# Altium schematic sheet Controller-Sheet.SchDoc
size 420 x 297 mm; SheetNumber: 4; SheetTotal: 5
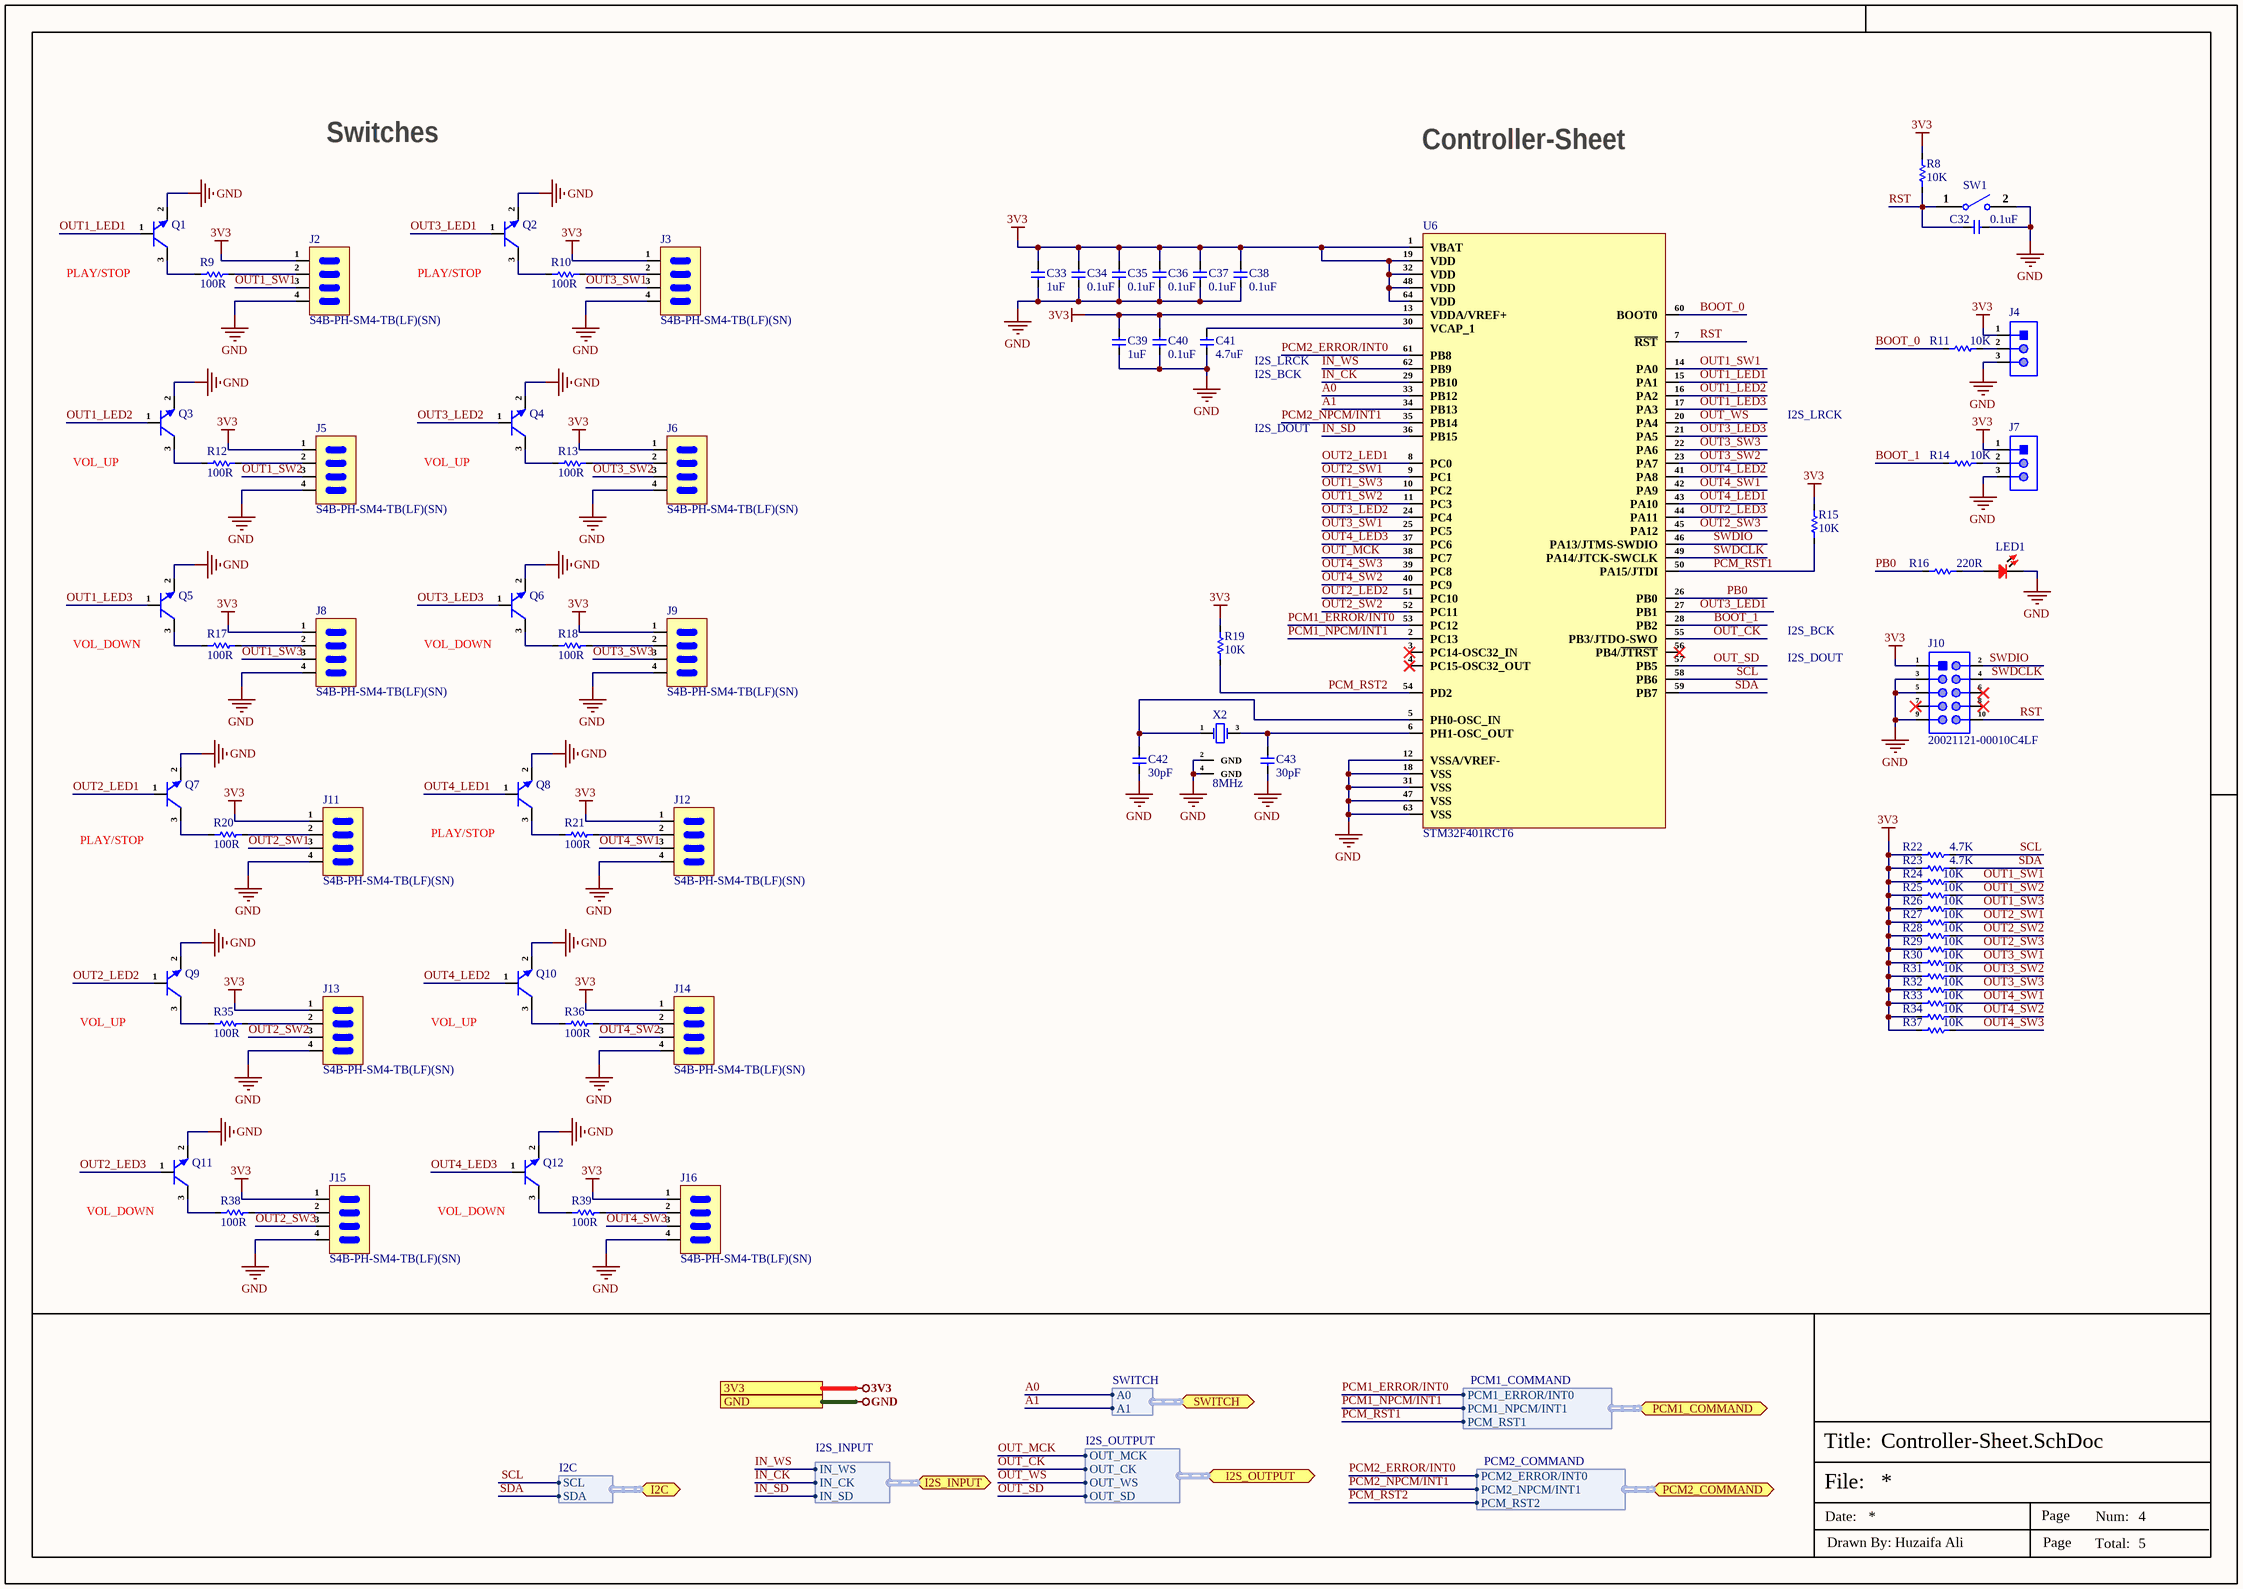
[diagram p0: Controller-Sheet.SchDoc]

## Parts
C32  0.1uF  [Cap-0402]
C33  1uF  [Cap-0402]
C34  0.1uF  [Cap-0402]
C35  0.1uF  [Cap-0402]
C36  0.1uF  [Cap-0402]
C37  0.1uF  [Cap-0402]
C38  0.1uF  [Cap-0402]
C39  1uF  [Cap-0402]
C40  0.1uF  [Cap-0402]
C41  4.7uF  [Cap-0402]
C42  30pF  [Cap-0402]
C43  30pF  [Cap-0402]
J2  S4B-PH-SM4-TB(LF)(SN)  [S4B-PH-SM4-TB(LF)(SN)]
J3  S4B-PH-SM4-TB(LF)(SN)  [S4B-PH-SM4-TB(LF)(SN)]
J4  X6511WV-03H-C60D30  [HDR1X3_]  (value not drawn)
J5  S4B-PH-SM4-TB(LF)(SN)  [S4B-PH-SM4-TB(LF)(SN)]
J6  S4B-PH-SM4-TB(LF)(SN)  [S4B-PH-SM4-TB(LF)(SN)]
J7  X6511WV-03H-C60D30  [HDR1X3_]  (value not drawn)
J8  S4B-PH-SM4-TB(LF)(SN)  [S4B-PH-SM4-TB(LF)(SN)]
J9  S4B-PH-SM4-TB(LF)(SN)  [S4B-PH-SM4-TB(LF)(SN)]
J10  20021121-00010C4LF  [20021121-00010C4LF_]
J11  S4B-PH-SM4-TB(LF)(SN)  [S4B-PH-SM4-TB(LF)(SN)]
J12  S4B-PH-SM4-TB(LF)(SN)  [S4B-PH-SM4-TB(LF)(SN)]
J13  S4B-PH-SM4-TB(LF)(SN)  [S4B-PH-SM4-TB(LF)(SN)]
J14  S4B-PH-SM4-TB(LF)(SN)  [S4B-PH-SM4-TB(LF)(SN)]
J15  S4B-PH-SM4-TB(LF)(SN)  [S4B-PH-SM4-TB(LF)(SN)]
J16  S4B-PH-SM4-TB(LF)(SN)  [S4B-PH-SM4-TB(LF)(SN)]
LED1  RED  [LED-0603]  (value not drawn)
Q1  DDTD113ZC-7-F  [SOT-23]  (value not drawn)
Q2  DDTD113ZC-7-F  [SOT-23]  (value not drawn)
Q3  DDTD113ZC-7-F  [SOT-23]  (value not drawn)
Q4  DDTD113ZC-7-F  [SOT-23]  (value not drawn)
Q5  DDTD113ZC-7-F  [SOT-23]  (value not drawn)
Q6  DDTD113ZC-7-F  [SOT-23]  (value not drawn)
Q7  DDTD113ZC-7-F  [SOT-23]  (value not drawn)
Q8  DDTD113ZC-7-F  [SOT-23]  (value not drawn)
Q9  DDTD113ZC-7-F  [SOT-23]  (value not drawn)
Q10  DDTD113ZC-7-F  [SOT-23]  (value not drawn)
Q11  DDTD113ZC-7-F  [SOT-23]  (value not drawn)
Q12  DDTD113ZC-7-F  [SOT-23]  (value not drawn)
R8  10K  [Res-0402]
R9  100R  [Res-0603]
R10  100R  [Res-0603]
R11  10K  [Res-0402]
R12  100R  [Res-0603]
R13  100R  [Res-0603]
R14  10K  [Res-0402]
R15  10K  [Res-0402]
R16  220R  [Res-0603]
R17  100R  [Res-0603]
R18  100R  [Res-0603]
R19  10K  [Res-0402]
R20  100R  [Res-0603]
R21  100R  [Res-0603]
R22  4.7K  [Res-0402]
R23  4.7K  [Res-0402]
R24  10K  [Res-0402]
R25  10K  [Res-0402]
R26  10K  [Res-0402]
R27  10K  [Res-0402]
R28  10K  [Res-0402]
R29  10K  [Res-0402]
R30  10K  [Res-0402]
R31  10K  [Res-0402]
R32  10K  [Res-0402]
R33  10K  [Res-0402]
R34  10K  [Res-0402]
R35  100R  [Res-0603]
R36  100R  [Res-0603]
R37  10K  [Res-0402]
R38  100R  [Res-0603]
R39  100R  [Res-0603]
SW1  B3U-1000P  [B3U-1000P]  (value not drawn)
U6  STM32F401RCT6  [64-LQFP (10x10)]
X2  8MHz  [5TJ480000XYLBC_]

## Ports
3V3 (see Top_Sheet[3A], I2S-to-SPDIF-Sheet[3D], Power-Sheet[4D], SPDIF-to-I2S-Sheet[3D]), GND (see Top_Sheet[3B], I2S-to-SPDIF-Sheet[3D], Power-Sheet[4D], SPDIF-to-I2S-Sheet[3D]), I2C (bidir, harness I2C, see Top_Sheet[3B], I2S-to-SPDIF-Sheet[2D], SPDIF-to-I2S-Sheet[2D]), I2S_INPUT (bidir, harness I2S_INPUT, see Top_Sheet[3B], SPDIF-to-I2S-Sheet[2D]), I2S_OUTPUT (bidir, harness I2S_OUTPUT, see Top_Sheet[4B], I2S-to-SPDIF-Sheet[2D]), PCM1_COMMAND (bidir, harness PCM1_COMMAND, see Top_Sheet[3B], SPDIF-to-I2S-Sheet[2D]), PCM2_COMMAND (bidir, harness PCM2_COMMAND, see Top_Sheet[4B], I2S-to-SPDIF-Sheet[2D]), SWITCH (bidir, harness SWITCH, see Top_Sheet[4B], I2S-to-SPDIF-Sheet[5D])

## Harnesses
I2S_INPUT: IN_WS, IN_CK, IN_SD
I2C: SCL, SDA
PCM2_COMMAND: PCM2_ERROR/INT0, PCM2_NPCM/INT1, PCM_RST2
PCM1_COMMAND: PCM1_ERROR/INT0, PCM1_NPCM/INT1, PCM_RST1
SWITCH: A0, A1
I2S_OUTPUT: OUT_MCK, OUT_CK, OUT_WS, OUT_SD

## Nets
3V3: C33.2 C34.2 C35.2 C36.2 C37.2 C38.2 C39.2 C40.2 J2.1 J3.1 J4.1 J5.1 J6.1 J7.1 J8.1 J9.1 J10.1 J11.1 J12.1 J13.1 J14.1 J15.1 J16.1 R8.2 R15.1 R19.1 R22.1 R23.1 R24.2 R25.2 R26.2 R27.2 R28.2 R29.2 R30.2 R31.2 R32.2 R33.2 R34.2 R37.2 U6.1(VBAT) U6.13(VDDA/VREF+) U6.19(VDD) U6.32(VDD) U6.48(VDD) U6.64(VDD) ; port 3V3
GND: C32.1 C33.1 C34.1 C35.1 C36.1 C37.1 C38.1 C39.1 C40.1 C41.1 C42.1 C43.1 J2.4 J3.4 J4.3 J5.4 J6.4 J7.3 J8.4 J9.4 J10.3 J10.5 J10.9 J11.4 J12.4 J13.4 J14.4 J15.4 J16.4 LED1.2 Q1.2(E) Q2.2(E) Q3.2(E) Q4.2(E) Q5.2(E) Q6.2(E) Q7.2(E) Q8.2(E) Q9.2(E) Q10.2(E) Q11.2(E) Q12.2(E) SW1.2 U6.12(VSSA/VREF-) U6.18(VSS) U6.31(VSS) U6.47(VSS) U6.63(VSS) X2.2(GND) X2.4(GND) ; port GND
A0: U6.33(PB12) ; port SWITCH.A0
A1: U6.34(PB13) ; port SWITCH.A1
BOOT_0: R11.2 U6.60(BOOT0)
BOOT_1: R14.2 U6.28(PB2)
IN_CK: U6.29(PB10) ; port I2S_INPUT.IN_CK
IN_SD: U6.36(PB15) ; port I2S_INPUT.IN_SD
IN_WS: U6.62(PB9) ; port I2S_INPUT.IN_WS
OUT1_LED1: Q1.1(B) U6.15(PA1)
OUT1_LED2: Q3.1(B) U6.16(PA2)
OUT1_LED3: Q5.1(B) U6.17(PA3)
OUT1_SW1: J2.3 R24.1 U6.14(PA0)
OUT1_SW2: J5.3 R25.1 U6.11(PC3)
OUT1_SW3: J8.3 R26.1 U6.10(PC2)
OUT2_LED1: Q7.1(B) U6.8(PC0)
OUT2_LED2: Q9.1(B) U6.51(PC10)
OUT2_LED3: Q11.1(B) U6.44(PA11)
OUT2_SW1: J11.3 R27.1 U6.9(PC1)
OUT2_SW2: J13.3 R28.1 U6.52(PC11)
OUT2_SW3: J15.3 R29.1 U6.45(PA12)
OUT3_LED1: Q2.1(B) U6.27(PB1)
OUT3_LED2: Q4.1(B) U6.24(PC4)
OUT3_LED3: Q6.1(B) U6.21(PA5)
OUT3_SW1: J3.3 R30.1 U6.25(PC5)
OUT3_SW2: J6.3 R31.1 U6.23(PA7)
OUT3_SW3: J9.3 R32.1 U6.22(PA6)
OUT4_LED1: Q8.1(B) U6.43(PA10)
OUT4_LED2: Q10.1(B) U6.41(PA8)
OUT4_LED3: Q12.1(B) U6.37(PC6)
OUT4_SW1: J12.3 R33.1 U6.42(PA9)
OUT4_SW2: J14.3 R34.1 U6.40(PC9)
OUT4_SW3: J16.3 R37.1 U6.39(PC8)
OUT_CK: U6.55(PB3/JTDO-SWO) ; port I2S_OUTPUT.OUT_CK
OUT_MCK: U6.38(PC7) ; port I2S_OUTPUT.OUT_MCK
OUT_SD: U6.57(PB5) ; port I2S_OUTPUT.OUT_SD
OUT_WS: U6.20(PA4) ; port I2S_OUTPUT.OUT_WS
PB0: R16.1 U6.26(PB0)
PCM1_ERROR/INT0: U6.53(PC12) ; port PCM1_COMMAND.PCM1_ERROR/INT0
PCM1_NPCM/INT1: U6.2(PC13) ; port PCM1_COMMAND.PCM1_NPCM/INT1
PCM2_ERROR/INT0: U6.61(PB8) ; port PCM2_COMMAND.PCM2_ERROR/INT0
PCM2_NPCM/INT1: U6.35(PB14) ; port PCM2_COMMAND.PCM2_NPCM/INT1
PCM_RST1: R15.2 U6.50(PA15/JTDI) ; port PCM1_COMMAND.PCM_RST1
PCM_RST2: R19.2 U6.54(PD2) ; port PCM2_COMMAND.PCM_RST2
RST: C32.2 J10.10 R8.1 SW1.1 U6.7(~{RST})
SCL: R22.2 U6.58(PB6) ; port I2C.SCL
SDA: R23.2 U6.59(PB7) ; port I2C.SDA
SWDCLK: J10.4 U6.49(PA14/JTCK-SWCLK)
SWDIO: J10.2 U6.46(PA13/JTMS-SWDIO)
NetC41_2: C41.2 U6.30(VCAP_1)
NetC42_2: C42.2 U6.5(PH0-OSC_IN) X2.1(OSC1)
NetC43_2: C43.2 U6.6(PH1-OSC_OUT) X2.3(OSC2)
NetJ2_2: J2.2 R9.2
NetJ3_2: J3.2 R10.2
NetJ4_2: J4.2 R11.1
NetJ5_2: J5.2 R12.2
NetJ6_2: J6.2 R13.2
NetJ7_2: J7.2 R14.1
NetJ8_2: J8.2 R17.2
NetJ9_2: J9.2 R18.2
NetJ11_2: J11.2 R20.2
NetJ12_2: J12.2 R21.2
NetJ13_2: J13.2 R35.2
NetJ14_2: J14.2 R36.2
NetJ15_2: J15.2 R38.2
NetJ16_2: J16.2 R39.2
NetLED1_1: LED1.1 R16.2
NetQ1_3: Q1.3(C) R9.1
NetQ2_3: Q2.3(C) R10.1
NetQ3_3: Q3.3(C) R12.1
NetQ4_3: Q4.3(C) R13.1
NetQ5_3: Q5.3(C) R17.1
NetQ6_3: Q6.3(C) R18.1
NetQ7_3: Q7.3(C) R20.1
NetQ8_3: Q8.3(C) R21.1
NetQ9_3: Q9.3(C) R35.1
NetQ10_3: Q10.3(C) R36.1
NetQ11_3: Q11.3(C) R38.1
NetQ12_3: Q12.3(C) R39.1

Not connected (* = marked no-connect by the designer): J10 6* 7* 8*; U6 3(PC14-OSC32_IN)* 4(PC15-OSC32_OUT)* 56(PB4/~{JTRST})*

## Notes on the sheet
- Switches
- Controller-Sheet
- (near Q1) PLAY/STOP
- (near Q2) PLAY/STOP
- (near C41) I2S_LRCK
- (near C41) I2S_BCK
- I2S_DOUT
- I2S_LRCK
- VOL_UP
- (near Q5) VOL_DOWN
- (near Q6) VOL_DOWN
- I2S_BCK
- (near Q7) PLAY/STOP
- (near Q8) PLAY/STOP
- (near Q11) VOL_DOWN
- (near Q12) VOL_DOWN
- File:
- Title:
- Date:
- Page
- Num:
- Total:
- Drawn By: Huzaifa Ali

## Library data of the parts
C32 C34-C38 C40 = CC0402KRX7R8BB104: CAP CER 0.1UF 25V X7R 0402; Manufacturer: Yageo; Tolerance: 10%; Capacitance: 100nF; Dissipation Factor: 3.5%; Supplier 1: Digi-Key; Manufacturer Part Number: CC0402KRX7R8BB104; RoHS: Yes; Category: Ceramic Capacitors; Stock 1: 1841009; Pricing 1: 1=0.10000, 10=0.03100, 50=0.01700, 100=0.01390, 500=0.00990, 1000=0.00777, 2500=0.00707, 5000=0.00650 (USD); Mount: Surface Mount; Case/Package: 0402; Case Code (Imperial): 0402; Case Code (Metric): 1005; Min Operating Temperature: -55°C; Max Operating Temperature: 125°C; Dielectric: X7R; Voltage Rating: 25V; Voltage Rating (DC): 25V; Packaging: Tape and Reel; Termination: SMD/SMT; Resistor Type: Ceramic; Length: 1mm; Width: 0.02inch; Height: 0.5mm; Thickness: 0.022inch; Depth: 0.5mm; Radiation Hardening: No; Lead Free: Lead Free; Halogen Free: Halogen Free; ComponentLink1URL: https://datasheet.ciiva.com/11464/upy-gphc-x7r-6-3v-to-50v-8-11464889.pdf?src-supplier=Avnet; ComponentLink1Description: https://datasheet.ciiva.com/11464/upy-gphc-x7r-6-3v-to-50v-8-11464889.pdf?src-supplier=Avnet; ComponentLink2URL: https://datasheet.ciiva.com/13210/upy-gphc-x7r-6-3v-to-50v-8-12304-13210908.pdf?src-supplier=Mouser; ComponentLink2Description: https://datasheet.ciiva.com/13210/upy-gphc-x7r-6-3v-to-50v-8-12304-13210908.pdf?src-supplier=Mouser; ComponentLink3URL: https://datasheet.ciiva.com/17437/upy-gphc-x7r-6-3v-to-50v-8-17437357.pdf?src-supplier=Avnet+Europe; ComponentLink3Description: https://datasheet.ciiva.com/17437/upy-gphc-x7r-6-3v-to-50v-8-17437357.pdf?src-supplier=Avnet+Europe; Supplier Part Number 1: 311-2077-1-ND; LCSC Part Number: C105883
C33 C39 = CC0402KRX5R7BB105: CAP CER 1UF 16V X5R 0402; Manufacturer: Yageo; Tolerance: 10%; Item Type: Capacitor; Supplier 1: Digi-Key; Manufacturer Part Number: CC0402KRX5R7BB105; Stock 1: 1405667; Pricing 1: 1=0.36, 10=0.252, 100=0.1512, 500=0.1134, 1000=0.09576, 2500=0.09072, 5000=0.08568 (USD); Mount: Surface Mount; Case/Package: 0402; Weight: 2.3E-05oz; Case Code (Imperial): 0402; Case Code (Metric): 1005; Min Operating Temperature: -55°C; Max Operating Temperature: 85°C; Capacitance: 1uF; Dielectric: X5R; Packaging: Tape and Reel; Voltage Rating (DC): 16V; Voltage Rating: 16V; Termination: SMD/SMT; Composition: Ceramic; Length: 1mm; Height: 0.5mm; Width: 0.02inch; Thickness: 0.022inch; Depth: 0.5mm; Radiation Hardening: No; Lead Free: Lead Free; Halogen Free: Halogen Free; ComponentLink1URL: http://www.yageo.com/documents/recent/UPY-GPHC_X5R_4V-to-50V_12.pdf?src-supplier=Avnet+Europe; ComponentLink1Description: http://www.yageo.com/documents/recent/UPY-GPHC_X5R_4V-to-50V_12.pdf?src-supplier=Avnet+Europe; Supplier Part Number 1: 311-1691-6-ND; LCSC Part Number: C325464
C41 = CL05A475MO5NUNC: CAP CER 4.7UF 16V X5R 0402; Manufacturer: Samsung; Material: 4241ConductorMaterial; Tolerance: 20%; Supplier 1: Avnet; Manufacturer Part Number: CL05A475MO5NUNC; RoHS: Yes; Category: Ceramic Capacitors; Stock 1: 50000; Pricing 1: 10000=0.09712 (USD); Mount: Surface Mount; Case/Package: 0402; Case Code (Metric): 1005; Case Code (Imperial): 0402; Min Operating Temperature: -55°C; Max Operating Temperature: 85°C; Packaging: Cut Tape; Capacitance: 4.7uF; Voltage Rating: 16V; Series: CL; Voltage Rating (DC): 16V; Length: 0.039inch; Width: 0.02inch; Height: 550um; Thickness: 0.022inch; RoHS Compliant: Yes; ComponentLink1URL: http://www.farnell.com/datasheets/2710653.pdf?src-supplier=Farnell; ComponentLink1Description: http://www.farnell.com/datasheets/2710653.pdf?src-supplier=Farnell; ComponentLink2URL: http://www.samsungsem.com/kr/support/product-search/mlcc/CL05A475MO5NUNC.jsp?src-supplier=Digikey; ComponentLink2Description: http://www.samsungsem.com/kr/support/product-search/mlcc/CL05A475MO5NUNC.jsp?src-supplier=Digikey; ComponentLink3URL: http://www.farnell.com/datasheets/2710653.pdf?src-supplier=Element14; ComponentLink3Description: http://www.farnell.com/datasheets/2710653.pdf?src-supplier=Element14; ComponentLink4URL: https://datasheet.octopart.com/CL05A475MO5NUNC-Samsung-Electro-Mechanics-datasheet-123102911.pdf?src-supplier=Future+Electronics; ComponentLink4Description: https://datasheet.octopart.com/CL05A475MO5NUNC-Samsung-Electro-Mechanics-datasheet-123102911.pdf?src-supplier=Future+Electronics; ComponentLink5URL: http://www.farnell.com/datasheets/2710653.pdf?src-supplier=Newark; ComponentLink5Description: http://www.farnell.com/datasheets/2710653.pdf?src-supplier=Newark; Supplier Part Number 1: CL05A475MO5NUNC
C42 C43 = CC0402JRNPO9BN300: CAP CER 30PF 50V C0G/NPO 0402; Manufacturer: Yageo; Temperature Coefficient: 30ppm/°C; Item Type: Capacitor; Supplier 1: Future Electronics; Manufacturer Part Number: CC0402JRNPO9BN300; RoHS: Yes; Category: Ceramic Capacitors; Stock 1: 540000; Pricing 1: 10000=0.0025, 40000=0.0024, 150000=0.0023, 400000=0.0022, 1000000=0.0021 (USD); Halogen Free: 5694HalogenFree; ComponentLink1URL: https://datasheet.ciiva.com/13263/upy-gp-np0-16v-to-50v-8-3714-13263961.pdf?src-supplier=Mouser; ComponentLink1Description: https://datasheet.ciiva.com/13263/upy-gp-np0-16v-to-50v-8-3714-13263961.pdf?src-supplier=Mouser; Supplier Part Number 1: 6784771
J2 J3 J5 J6 J8 J9 J11-J16 = S4B-PH-SM4-TB(LF)(SN): CONN HEADER SMD R/A 4POS 2MM; Manufacturer: JST; Item Type: Connectors; Gender: 29Gender; Supplier: Future Electronics; Supplier Part Number: 7687031; Manufacturer Part Number: S4B-PH-SM4-TB(LF)(SN); RoHS: Yes; Stock: 78; Pricing: 1=0.935, 10=0.83, 40=0.77, 150=0.71, 500=0.655 (USD); ComponentLink1URL: https://datasheet.ciiva.com/11746/0900766b80df0d9d-11746552.pdf?src-supplier=Rs; ComponentLink1Description: https://datasheet.ciiva.com/11746/0900766b80df0d9d-11746552.pdf?src-supplier=Rs; ComponentLink2URL: https://datasheet.ciiva.com/712/eph-712578.pdf?src-supplier=Digikey; ComponentLink2Description: https://datasheet.ciiva.com/712/eph-712578.pdf?src-supplier=Digikey; ComponentLink3URL: https://datasheet.ciiva.com/712/eph-712579.pdf?src-supplier=Digikey; ComponentLink3Description: https://datasheet.ciiva.com/712/eph-712579.pdf?src-supplier=Digikey; ComponentLink4URL: https://datasheet.ciiva.com/730/eph-730675.pdf?src-supplier=Digikey; ComponentLink4Description: https://datasheet.ciiva.com/730/eph-730675.pdf?src-supplier=Digikey; ComponentLink5URL: https://datasheet.ciiva.com/8052/1699381-8052234.pdf?src-supplier=Element14; ComponentLink5Description: https://datasheet.ciiva.com/8052/1699381-8052234.pdf?src-supplier=Element14; LCSC Part Number: C265102
J4 J7 = X6511WV-03H-C60D30: Gold 250V 3A Straight Square Pins 2.5mm 3P 260℃ 6mm -40℃~+105℃ 3mm 2.54mm Plugin Black Brass 1x3P Plugin,P=2.54mm Pin Headers ROHS; Manufacturer: XKB; Item Type: Male Header; Manufacturer Part Number: X6511WV-03H-C60D30; Package: Plugin,P=2.54mm; LCSC Part Number: C706875; ComponentLink1Description: LCSC; ComponentLink1URL: https://www.lcsc.com/product-detail/Pin-Headers_XKB-Connectivity-X6511WV-03H-C60D30_C706875.html
J10 = 20021121-00010C4LF: CONN HEADER SMD 10POS 1.27MM; Manufacturer: Amphenol FCI; Number of Contacts: 10; Contact Resistance: 30mR; Current Rating: 1A; Voltage Rating: 125V; Insulation Resistance: 100MR; Gender: Male; Connector Type: Male Pin,Header; Row Spacing: 0.05inch; Stack Height: 3mm; Item Type: Jtag Male Header; Supplier 1: Digi-Key; Manufacturer Part Number: 20021121-00010C4LF; Stock 1: 0; Pricing 1: 1=0.87, 10=0.761, 100=0.6563 (USD); Mount: Surface Mount; Contact Plating: Gold; Contact Material: Copper Alloy,Copper,Gold; Color: Black; Housing Color: Black; Housing Material: Thermoplastic; Min Operating Temperature: -40°C; Max Operating Temperature: 85°C; Number of Rows: 2; Termination: Solder; Packaging: Tape and Reel; Package Quantity: 600; Number of Positions: 10; Max Voltage Rating (AC): 125V; Orientation: Straight; Length: 6.35mm; Pitch: 1.27mm; Contact Mating Length: 0.12inch; Depth: 3.4mm; Radiation Hardening: No; REACH SVHC: No SVHC; ComponentLink1URL: https://www.verical.com/server-webapp/html/getDatasheet?partID=177140&src-supplier=Verical; ComponentLink1Description: https://www.verical.com/server-webapp/html/getDatasheet?partID=177140&src-supplier=Verical; ComponentLink2URL: http://portal.fciconnect.com/Comergent/fci/drawing/20021121.pdf?src-supplier=Avnet; ComponentLink2Description: http://portal.fciconnect.com/Comergent/fci/drawing/20021121.pdf?src-supplier=Avnet; ComponentLink3URL: https://cdn.amphenol-icc.com/media/wysiwyg/files/drawing/20021121.pdf?src-supplier=Digi-Key; ComponentLink3Description: https://cdn.amphenol-icc.com/media/wysiwyg/files/drawing/20021121.pdf?src-supplier=Digi-Key; ComponentLink4URL: http://portal.fciconnect.com/Comergent/fci/drawing/20021121.pdf?src-supplier=Avnet+Europe; ComponentLink4Description: http://portal.fciconnect.com/Comergent/fci/drawing/20021121.pdf?src-supplier=Avnet+Europe; ComponentLink5URL: https://media.digikey.com/pdf/Data%20Sheets/FCI%20PDFs/Minitek%20127_Catalog.pdf?src-supplier=Digi-Key; ComponentLink5Description: https://media.digikey.com/pdf/Data%20Sheets/FCI%20PDFs/Minitek%20127_Catalog.pdf?src-supplier=Digi-Key; ComponentLink6URL: http://portal.fciconnect.com/Comergent//fci/drawing/20021121.pdf?src-supplier=Mouser; ComponentLink6Description: http://portal.fciconnect.com/Comergent//fci/drawing/20021121.pdf?src-supplier=Mouser; Supplier Part Number 1: 609-3695-6-ND; LCSC Part Number: C150517
LED1 = NCD0603R3: RED LED 0603 Light Emitting Diodes; Manufacturer: Foshan NationStar Optoelectronics; Manufacturer Part Number: NCD0603R3; Package: 0603; Item Type: LED; LCSC Part Number: C3151730; ComponentLink1Description: LCSC; ComponentLink1URL: https://www.lcsc.com/product-detail/Light-Emitting-Diodes-LED_Foshan-NationStar-Optoelectronics-NCD0603R3_C3151730.html
Q1-Q12 = DDTD113ZC-7-F: TRANS PREBIAS NPN 50V SOT23-3; Manufacturer: Diodes Zetex; Item Type: BJTs; Supplier: Digikey; Supplier Part Number: DDTD113ZC-7FDICT-ND; Manufacturer Part Number: DDTD113ZC-7-F; RoHS: Yes; Stock: 793860; Pricing: 1=0.31, 10=0.21, 100=0.1027, 500=0.08562, 1000=0.05949 (USD); ComponentLink1URL: https://datasheet.ciiva.com/15139/getdatasheetpartid-323116-15139824.pdf?src-supplier=Verical; ComponentLink1Description: https://datasheet.ciiva.com/15139/getdatasheetpartid-323116-15139824.pdf?src-supplier=Verical
R8 R11 R14 R15 R19 R24-R34 R37 = RC0402FR-0710KL: RES 10K OHM 1% 1/16W 0402; Manufacturer: Yageo; Resistance: 10kR; Voltage Rating (DC): 50V; Temperature Coefficient: 100ppm/°C; Power Rating: 62.5mW; Max Power Dissipation: 63mW; Item Type: Resistor; Supplier 1: Mouser; Manufacturer Part Number: RC0402FR-0710KL; RoHS: Yes; Category: Chip SMD Resistors; Stock 1: 18648329; Pricing 1: 1=0.10000, 10=0.01400, 50=0.01400, 100=0.00500, 1000=0.00300, 10000=0.00200 (USD); Case/Package: 0402; Number of Pins: 2; Case Code (Imperial): 0402; Case Code (Metric): 1005; Min Operating Temperature: -55°C; Max Operating Temperature: 155°C; Resistor Type: Thick Film; Tolerance: 1%; Packaging: Tape and Reel; Voltage Rating: 50V; Termination: SMD/SMT; Working Voltage: 50V; Number of Terminations: 2; Features: Moisture Resistant; Series: RC; Resistance Tolerance: 1%; Construction: Rectangular; Length: 1mm; Width: 0.5mm; Height: 0.32mm; Depth: 0.5mm; Lead Pitch: 0.2mm; REACH SVHC: No SVHC; Lead Free: Lead Free; RoHS Compliant: Yes; Military Standard: Not; ComponentLink1URL: https://datasheet.ciiva.com/7660/38568-7660787.pdf?src-supplier=Element14; ComponentLink1Description: https://datasheet.ciiva.com/7660/38568-7660787.pdf?src-supplier=Element14; ComponentLink2URL: https://datasheet.ciiva.com/7849/1686128-7849814.pdf?src-supplier=Element14; ComponentLink2Description: https://datasheet.ciiva.com/7849/1686128-7849814.pdf?src-supplier=Element14; ComponentLink3URL: https://datasheet.ciiva.com/7983/1018594-7983486.pdf?src-supplier=Element14; ComponentLink3Description: https://datasheet.ciiva.com/7983/1018594-7983486.pdf?src-supplier=Element14; ComponentLink4URL: https://datasheet.ciiva.com/22747/1018594-22747512.pdf?src-supplier=Element14; ComponentLink4Description: https://datasheet.ciiva.com/22747/1018594-22747512.pdf?src-supplier=Element14; ComponentLink5URL: https://datasheet.ciiva.com/12667/pyu-rc0402-51-rohs-l-6-r-12667067.pdf?src-supplier=Mouser; ComponentLink5Description: https://datasheet.ciiva.com/12667/pyu-rc0402-51-rohs-l-6-r-12667067.pdf?src-supplier=Mouser; ComponentLink6URL: https://datasheet.ciiva.com/7849/1784430-7849813.pdf?src-supplier=Element14; ComponentLink6Description: https://datasheet.ciiva.com/7849/1784430-7849813.pdf?src-supplier=Element14; ComponentLink7URL: https://datasheet.ciiva.com/7849/1784430-7849815.pdf?src-supplier=Element14; ComponentLink7Description: https://datasheet.ciiva.com/7849/1784430-7849815.pdf?src-supplier=Element14; Supplier Part Number 1: 603-RC0402FR-0710KL; LCSC Part Number: C60490
R9 R10 R12 R13 R17 R18 R20 R21 R35 R36 R38 R39 = RC0603FR-07100RL: RES SMD 100 OHM 1% 1/10W 0603; Manufacturer: Yageo; Temperature Coefficient: 100ppm/°C; Voltage Rating (DC): 50V; Power Rating: 100mW; Item Type: Resistor; Supplier 1: Arrow Electronics; Manufacturer Part Number: RC0603FR-07100RL; RoHS: Yes; Category: Chip SMD Resistors; Stock 1: 3800000; Pricing 1: 5000=0.00300, 5000=0.00200, 5000=0.00450, 50000=0.00410, 500000=0.00230, 2500000=0.00140 (USD); Case/Package: 0603; Number of Pins: 2; Case Code (Imperial): 0603; Case Code (Metric): 1608; Size Code: 0603; Min Operating Temperature: -55°C; Max Operating Temperature: 155°C; Resistance: 100R; Tolerance: 1%; Resistor Type: Thick Film; Packaging: Tape and Reel; Voltage Rating: 50V; Termination: SMD/SMT; Features: Moisture Resistant; Series: RC; Max Power Dissipation: 100mW; Number of Terminations: 2; Construction: Rectangular; Resistance Tolerance: 1%; Technology: THICK FILM; Length: 1.6mm; Width: 0.8mm; Height: 0.45mm; Depth: 0.8mm; REACH SVHC: Unknown; Lead Free: Lead Free; RoHS Compliant: Yes; Military Standard: Not; Supplier Part Number 1: RC0603FR-07100RL; LCSC Part Number: C105588
R16 = RC0603FR-07220RL: RES SMD 220 OHM 1% 1/10W 0603; Manufacturer: Yageo; Temperature Coefficient: 100ppm/°C; Voltage Rating (DC): 50V; Power Rating: 100mW; Item Type: Resistor; Supplier 1: Digi-Key; Manufacturer Part Number: RC0603FR-07220RL; Stock 1: 5843995; Pricing 1: 1=0.1, 10=0.023, 100=0.0094, 1000=0.00421, 2500=0.00366 (USD); Case/Package: 0603; Number of Pins: 2; Case Code (Imperial): 0603; Case Code (Metric): 1608; Min Operating Temperature: -55°C; Max Operating Temperature: 155°C; Resistance: 220R; Tolerance: 1%; Composition: Thick Film; Packaging: Tape and Reel; Voltage Rating: 50V; Package Quantity: 1; Termination: SMD/SMT; Number of Terminations: 2; Military Standard: Not; Max Power Dissipation: 100mW; Features: Moisture Resistant; Length: 1.6mm; Height: 0.022inch; Width: 0.031inch; Depth: 0.8mm; REACH SVHC: No SVHC; Lead Free: Lead Free; ComponentLink1URL: http://www.yageo.com/documents/recent/PYu-RC_Group_51_RoHS_L_10.pdf?src-supplier=Digi-Key; ComponentLink1Description: http://www.yageo.com/documents/recent/PYu-RC_Group_51_RoHS_L_10.pdf?src-supplier=Digi-Key; ComponentLink2URL: http://www.farnell.com/datasheets/1868787.pdf?src-supplier=Element14; ComponentLink2Description: http://www.farnell.com/datasheets/1868787.pdf?src-supplier=Element14; Supplier Part Number 1: 311-220HRCT-ND; LCSC Part Number: C107696
R22 R23 = RC0402FR-074K7L: RES 4.7K OHM 1% 1/16W 0402; Manufacturer: Yageo; Voltage Rating (DC): 50V; Power Rating: 62.5mW; Resistance: 4.7kR; Temperature Coefficient: 100ppm/°C; Max Power Dissipation: 63mW; Item Type: Resistor; Supplier 1: Avnet; Manufacturer Part Number: RC0402FR-074K7L; RoHS: Yes; Category: Chip SMD Resistors; Stock 1: 2420000; Pricing 1: 10000=0.00085 (USD); Case/Package: 0402; Number of Pins: 2; Case Code (Imperial): 0402; Case Code (Metric): 1005; Size Code: 0402; Min Operating Temperature: -55°C; Max Operating Temperature: 155°C; Tolerance: 1%; Voltage Rating: 50V; Packaging: Tape and Reel; Resistor Type: Thick Film; Termination: SMD/SMT; Features: Moisture Resistant; Series: RC; Number of Terminations: 2; Resistance Tolerance: 1%; Construction: Rectangular; Length: 1mm; Width: 0.5mm; Height: 0.32mm; Depth: 0.5mm; Height - Seated (Max): 0.016inch; RoHS Compliant: Yes; Reach SVHC Compliant: Yes; Military Standard: Not; Lead Free: Lead Free; ComponentLink1URL: https://datasheet.ciiva.com/22661/1686128-22661342.pdf?src-supplier=Element14; ComponentLink1Description: https://datasheet.ciiva.com/22661/1686128-22661342.pdf?src-supplier=Element14; ComponentLink2URL: https://datasheet.ciiva.com/7850/1018594-7850022.pdf?src-supplier=Element14; ComponentLink2Description: https://datasheet.ciiva.com/7850/1018594-7850022.pdf?src-supplier=Element14; ComponentLink3URL: https://datasheet.ciiva.com/7850/1018594-7850023.pdf?src-supplier=Element14; ComponentLink3Description: https://datasheet.ciiva.com/7850/1018594-7850023.pdf?src-supplier=Element14; ComponentLink4URL: https://datasheet.ciiva.com/15215/getdatasheetpartid-328119-15215035.pdf?src-supplier=Verical; ComponentLink4Description: https://datasheet.ciiva.com/15215/getdatasheetpartid-328119-15215035.pdf?src-supplier=Verical; Supplier Part Number 1: RC0402FR-074K7L; LCSC Part Number: C105871
SW1 = B3U-1000P: SWITCH TACTILE SPST-NO 0.05A 12V; Manufacturer: Omron; Mechanical Life: 200000Cycles; Operating Force: 1.5N; Throw Configuration: SPST; Current Rating: 50mA; Contact Resistance: 100mR; Illumination Type: Non-Illuminated,Illuminated; Switch Travel: 0.15mm; Switch Function: Off-Mom; Actuator Type: Standard; Actuator Length: 0.4mm; Ratings: Dust Proof,IP40; ComponentLink1URL: http://www.farnell.com/datasheets/60838.pdf?src-supplier=Farnell; ComponentLink1Description: http://www.farnell.com/datasheets/60838.pdf?src-supplier=Farnell; ComponentLink2URL: http://www.farnell.com/datasheets/60838.pdf?src-supplier=Element14; ComponentLink2Description: http://www.farnell.com/datasheets/60838.pdf?src-supplier=Element14; ComponentLink3URL: https://omronfs.omron.com/en_US/ecb/products/pdf/en-b3u.pdf?src-supplier=Digi-Key; ComponentLink3Description: https://omronfs.omron.com/en_US/ecb/products/pdf/en-b3u.pdf?src-supplier=Digi-Key; ComponentLink4URL: http://www.omron.com/ecb/products/pdf/en-b3u.pdf?src-supplier=Digi-Key; ComponentLink4Description: http://www.omron.com/ecb/products/pdf/en-b3u.pdf?src-supplier=Digi-Key; ComponentLink5URL: https://www.distrelec.biz/Web/Downloads/he/et/B3U_eng_datasheet.pdf?mime=application%2Fpdf&src-supplier=Distrelec; ComponentLink5Description: https://www.distrelec.biz/Web/Downloads/he/et/B3U_eng_datasheet.pdf?mime=application%2Fpdf&src-supplier=Distrelec; ComponentLink6URL: http://www.onlinecomponents.com/productFiles/mf-OM/en-b3u.pdf?src-supplier=Onlinecomponents.com; ComponentLink6Description: http://www.onlinecomponents.com/productFiles/mf-OM/en-b3u.pdf?src-supplier=Onlinecomponents.com; Supplier 1: Digi-Key; Manufacturer Part Number: B3U-1000P; Stock 1: 116454; Pricing 1: 1=1, 10=0.961, 25=0.9064, 50=0.7976, 100=0.7251, 250=0.68888, 500=0.67074, 1000=0.52571 (USD); Mount: Surface Mount; Weight: 0.000776oz; Contact Material: Silver; Min Operating Temperature: -25°C; Max Operating Temperature: 70°C; Packaging: Tape and Reel; Voltage Rating (DC): 12V; Package Quantity: 1; Max Current Rating: 50mA; Termination: SMD/SMT; Orientation: Straight; Max Voltage Rating (DC): 12V; Electrical Life: 200000Cycles; Insulation Resistance: 100MR; Contact Current Rating: 50mA; Length: 4mm; Height: 1.2mm; Depth: 2.5mm; Width: 3mm; REACH SVHC: Unknown; Lead Free: Lead Free; ComponentLink7URL: https://www.verical.com/server-webapp/html/getDatasheet?partID=552554&src-supplier=Verical; ComponentLink7Description: https://www.verical.com/server-webapp/html/getDatasheet?partID=552554&src-supplier=Verical; ComponentLink8URL: http://www.farnell.com/datasheets/1685550.pdf?src-supplier=Element14; ComponentLink8Description: http://www.farnell.com/datasheets/1685550.pdf?src-supplier=Element14; ComponentLink9URL: http://www.farnell.com/datasheets/2610940.pdf?src-supplier=Farnell; ComponentLink9Description: http://www.farnell.com/datasheets/2610940.pdf?src-supplier=Farnell; ComponentLink10URL: https://www.alliedelec.com/m/d/4c8a9ef82804fc3c241a13c1e298fd73.pdf?src-supplier=Allied+Electronics; ComponentLink10Description: https://www.alliedelec.com/m/d/4c8a9ef82804fc3c241a13c1e298fd73.pdf?src-supplier=Allied+Electronics; Supplier Part Number 1: SW1020DKR-ND; LCSC Part Number: C231329; Item Type: Switch
U6 = STM32F401RCT6: IC MCU 32BIT 256KB FLASH 64LQFP; Manufacturer: STMicroelectronics; Item Type: Microcontrollers; Max Supply Voltage: 3.6V; Min Supply Voltage: 1.8V; Core Architecture: ARM; RAM Size: 64KB; Interface: I2C,SPI,USB,IrDA,SDIO,UART,USART,I2S; Number of I/Os: 50; Number of Timers/Counters: 8; Operating Supply Voltage: 3.3V; Oscillator Type: Internal; Data Bus Width: 32b; Clock Frequency: 84MHz; Watchdog Timer: Yes; Peripherals: Brown-out Detect/Reset,POR,PWM,WDT,DMA; Max Power Dissipation: 313mW; Number of USB Channels: 1; Number of SPI Channels: 7; Number of PWM Channels: 4; Number of I2C Channels: 3; Nominal Supply Current: 1.8uA; Number of A/D Converters: 1NUMBER; Number of Channels: 16NUMBER; Supplier: Mouser; Supplier Part Number: 511-STM32F401RCT6; Manufacturer Part Number: STM32F401RCT6; RoHS: Yes; Stock: 3502; Pricing: 1=5.1, 10=4.73, 25=4.34, 50=4.34, 100=4.08, 250=3.74, 500=3.73, 960=3.36, 1000=3.36, 10000=3.36 (USD); Case/Package: LQFP; Pins: 64; Weight: 0.012088oz; Min Operating Temperature: -40°C; Max Operating Temperature: 85°C; Packaging: Tray; Package Quantity: 960; Number of Programmable I/O: 50; Memory Format: FLASH; Memory Size: 256KB; Series: STM32F4; Frequency: 84MHz; Length: 10mm; Width: 10mm; Height: 1.45mm; Radiation Hardening: No; RoHS Compliant: Yes; Reach SVHC Compliant: No; Lead Free: Lead Free; ComponentLink1URL: https://datasheet.ciiva.com/29721/dm00086815-29721898.pdf?src-supplier=Digikey; ComponentLink1Description: https://datasheet.ciiva.com/29721/dm00086815-29721898.pdf?src-supplier=Digikey; ComponentLink2URL: https://datasheet.ciiva.com/24182/dm00086815-24182823.pdf?src-supplier=Future+Electronics; ComponentLink2Description: https://datasheet.ciiva.com/24182/dm00086815-24182823.pdf?src-supplier=Future+Electronics
X2 = 5TJ480000XYLBC: 8MHz 18pF ±10ppm SMD5032-4P Crystals ROHS; Manufacturer: JYJE; Manufacturer Part Number: 5TJ480000XYLBC; ComponentLink1Description: LCSC; ComponentLink1URL: https://www.lcsc.com/product-detail/Crystals_JYJE-5TJ480000XYLBC_C2149247.html; Package: SMD5032-4P; LCSC Part Number: C2149247; Item Type: Crystal